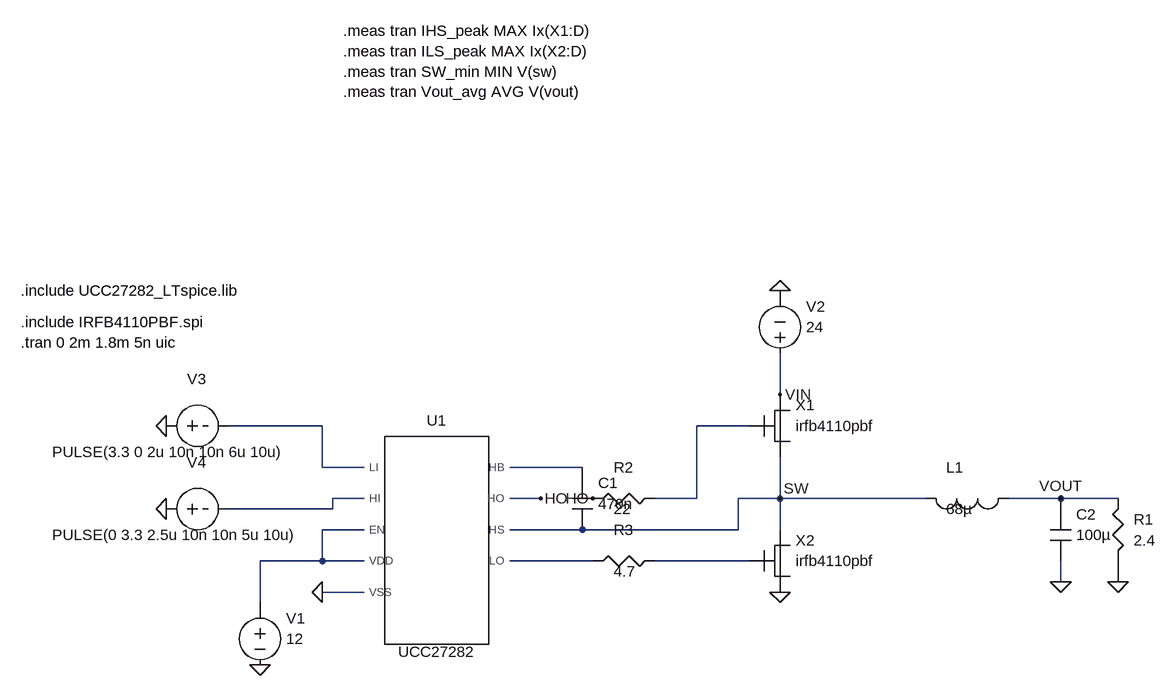
[diagram p0: schematic GateDriver_recreated.asc]
GateDriver_recreated.asc, the LTspice schematic file:
Version 4
SHEET 1 2048 1168
WIRE 1232 192 1232 128
WIRE 528 240 384 240
WIRE 1184 240 1104 240
WIRE 528 304 528 240
WIRE 592 304 528 304
WIRE 928 304 816 304
WIRE 592 352 544 352
WIRE 864 352 816 352
WIRE 1104 352 1104 240
WIRE 1104 352 1040 352
WIRE 1232 352 1232 288
WIRE 1232 352 1168 352
WIRE 1456 352 1232 352
WIRE 1664 352 1584 352
WIRE 1752 352 1664 352
WIRE 544 368 544 352
WIRE 544 368 384 368
WIRE 592 400 528 400
WIRE 928 400 816 400
WIRE 1168 400 1168 352
WIRE 1168 400 928 400
WIRE 1232 400 1232 352
WIRE 528 448 528 400
WIRE 528 448 432 448
WIRE 592 448 528 448
WIRE 944 448 816 448
WIRE 1184 448 1040 448
WIRE 1664 480 1664 448
WIRE 592 496 528 496
WIRE 432 512 432 448
FLAG 288 240 0
FLAG 288 368 0
FLAG 432 608 0
FLAG 528 496 0
FLAG 1232 32 0
FLAG 1232 496 0
FLAG 1664 480 0
FLAG 1752 480 0
FLAG 864 352 HO
FLAG 944 352 HO
FLAG 1232 352 SW
FLAG 1664 352 VOUT
FLAG 1232 192 VIN
SYMBOL Buck_Vpulse_H 288 192 R0
SYMATTR InstName V3
SYMATTR Value PULSE(3.3 0 2u 10n 10n 6u 10u)
SYMBOL Buck_Vpulse_H 288 320 R0
SYMATTR InstName V4
SYMATTR Value PULSE(0 3.3 2.5u 10n 10n 5u 10u)
SYMBOL UCC27282 624 256 R0
SYMATTR InstName U1
SYMBOL Buck_Vsrc 416 512 R0
SYMATTR InstName V1
SYMBOL Buck_Vsrc_Inv 1216 32 R0
SYMATTR InstName V2
SYMBOL Buck_Cap_V 912 304 R0
SYMATTR InstName C1
SYMBOL Buck_Res_H 944 336 R0
SYMATTR InstName R2
SYMATTR Value 22
SYMBOL Buck_Res_H 944 432 R0
SYMATTR InstName R3
SYMBOL Buck_NMOS_Subckt 1184 192 R0
SYMATTR InstName X1
SYMBOL Buck_NMOS_Subckt 1184 400 R0
SYMATTR InstName X2
SYMBOL Buck_Ind_H 1456 336 R0
SYMATTR InstName L1
SYMATTR Value 68µ
SYMBOL Buck_Cap_V 1648 352 R0
SYMATTR InstName C2
SYMATTR Value 100µ
SYMBOL Buck_Res_V 1736 352 R0
SYMATTR InstName R1
TEXT 64 32 Left 2 !.include UCC27282_LTspice.lib
TEXT 64 80 Left 2 !.include IRFB4110PBF.spi
TEXT 64 112 Left 2 !.tran 0 2m 1.8m 5n uic
TEXT 560 -368 Left 2 !.meas tran IHS_peak MAX Ix(X1:D)\n.meas tran ILS_peak MAX Ix(X2:D)\n.meas tran SW_min MIN V(sw)\n.meas tran Vout_avg AVG V(vout)

The netlist it stands for:
* GateDriver_recreated.asc
V3 N001 0 PULSE(3.3 0 2u 10n 10n 6u 10u)
V4 N004 0 PULSE(0 3.3 2.5u 10n 10n 5u 10u)
XU1 N001 N004 N005 N005 0 N003 HO SW N006 UCC27282  ; pins LI HI EN VDD VSS HB HO HS LO
V1 N005 0 12
V2 VIN 0 24
C1 N003 SW 470n
R2 HO N002 22
R3 N006 N007 4.7
XX1 VIN N002 SW irfb4110pbf  ; pins D G S
XX2 SW N007 0 irfb4110pbf  ; pins D G S
L1 SW VOUT 68µ
C2 VOUT 0 100µ
R1 VOUT 0 2.4
.include UCC27282_LTspice.lib
.include IRFB4110PBF.spi
.tran 0 2m 1.8m 5n uic
.meas tran IHS_peak MAX Ix(X1:D)
.meas tran ILS_peak MAX Ix(X2:D)
.meas tran SW_min MIN V(sw)
.meas tran Vout_avg AVG V(vout)
.backanno
.end